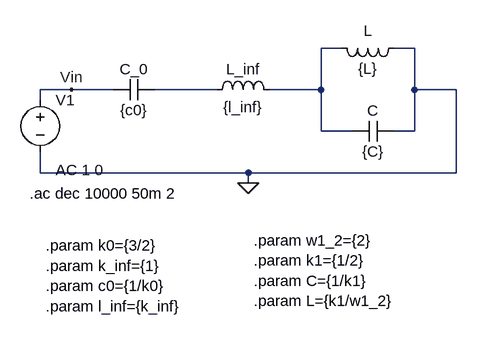
[diagram p0: schematic foster_serie.asc]
foster_serie.asc, the LTspice schematic file:
Version 4.1
SHEET 1 880 680
WIRE 416 80 384 80
WIRE 528 80 496 80
WIRE 0 144 -48 144
WIRE 64 144 0 144
WIRE 224 144 128 144
WIRE 384 144 384 80
WIRE 384 144 304 144
WIRE 528 144 528 80
WIRE 592 144 528 144
WIRE -48 160 -48 144
WIRE 384 208 384 144
WIRE 432 208 384 208
WIRE 528 208 528 144
WIRE 528 208 496 208
WIRE -48 272 -48 240
WIRE 272 272 -48 272
WIRE 592 272 592 144
WIRE 592 272 272 272
WIRE 272 288 272 272
FLAG 272 288 0
FLAG 0 144 Vin
SYMBOL cap 128 128 R90
WINDOW 0 0 32 VBottom 2
WINDOW 3 32 32 VTop 2
SYMATTR InstName C_0
SYMATTR Value {c0}
SYMBOL ind 208 160 R270
WINDOW 0 32 56 VTop 2
WINDOW 3 5 56 VBottom 2
SYMATTR InstName L_inf
SYMATTR Value {l_inf}
SYMATTR SpiceLine Rser=1m
SYMBOL ind 512 64 R90
WINDOW 0 5 56 VBottom 2
WINDOW 3 32 56 VTop 2
SYMATTR InstName L
SYMATTR Value {L}
SYMATTR SpiceLine Rser=1m
SYMBOL cap 496 192 R90
WINDOW 0 0 32 VBottom 2
WINDOW 3 32 32 VTop 2
SYMATTR InstName C
SYMATTR Value {C}
SYMBOL voltage -48 144 R0
WINDOW 123 24 124 Left 2
WINDOW 39 0 0 Left 0
SYMATTR Value2 AC 1 0
SYMATTR InstName V1
SYMATTR Value ""
TEXT -64 304 Left 2 !.ac dec 10000 50m 2
TEXT -40 384 Left 2 !.param k0={3/2}\n.param k_inf={1}\n.param c0={1/k0}\n.param l_inf={k_inf}
TEXT 280 376 Left 2 !.param w1_2={2}\n.param k1={1/2}\n.param C={1/k1}\n.param L={k1/w1_2}

The netlist it stands for:
* foster_serie.asc
C_0 N002 Vin {c0}
L_inf N002 N001 {l_inf} Rser=1m
L 0 N001 {L} Rser=1m
C 0 N001 {C}
V1 Vin 0 AC 1 0
.ac dec 10000 50m 2
.param k0={3/2}
.param k_inf={1}
.param c0={1/k0}
.param l_inf={k_inf}
.param w1_2={2}
.param k1={1/2}
.param C={1/k1}
.param L={k1/w1_2}
.backanno
.end